# Altium project tracker-pro-airbnb-v1.0.PrjPcb (part 6 of 6)
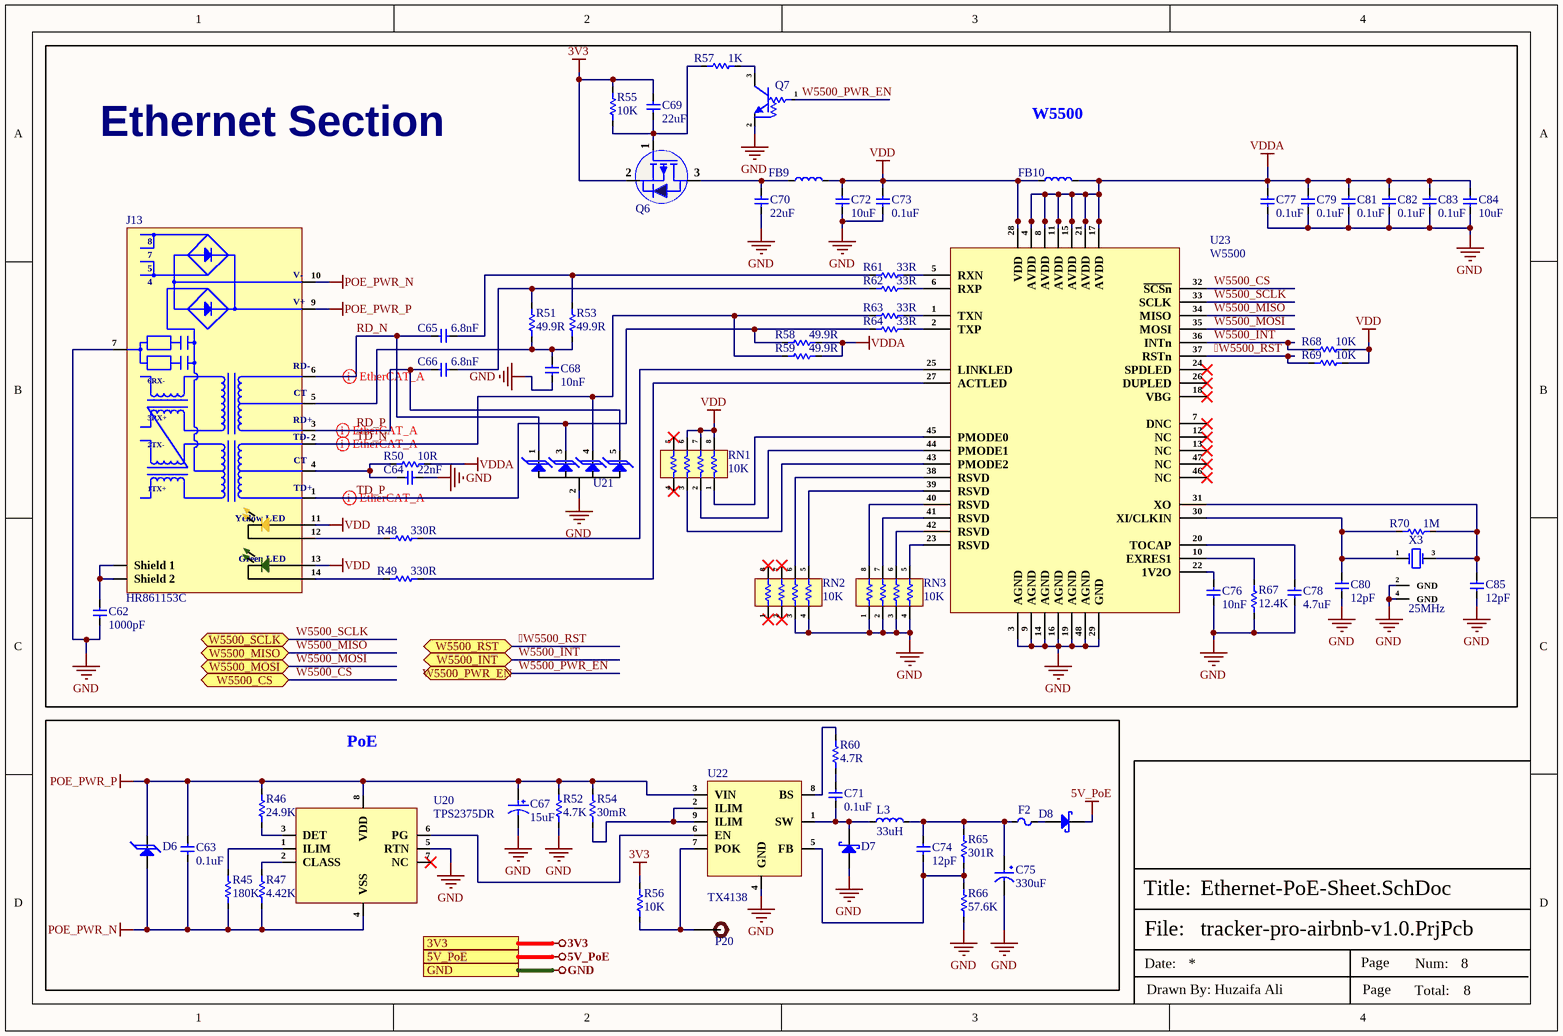
[diagram p9: Ethernet-PoE-Sheet.SchDoc]

## Sheet Ethernet-PoE-Sheet.SchDoc (continued)

### Library data of the parts (continued)
X3 = Q22FA12800090: CRYSTAL 25.0000MHZ 12PF SMD; Manufacturer: Seiko Epson; ComponentLink1Description: LCSC; ComponentLink1URL: https://www.lcsc.com/product-detail/Crystals_Seiko-Epson-Q22FA12800090_C255883.html; Manufacturer Part Number: Q22FA12800090; Package: SMD2016-4P; LCSC Part Number: C255883; Item Type: Crystal

## Sheet Sound-Detection-Sheet.SchDoc
size A4; SheetNumber: 6; SheetTotal: 8
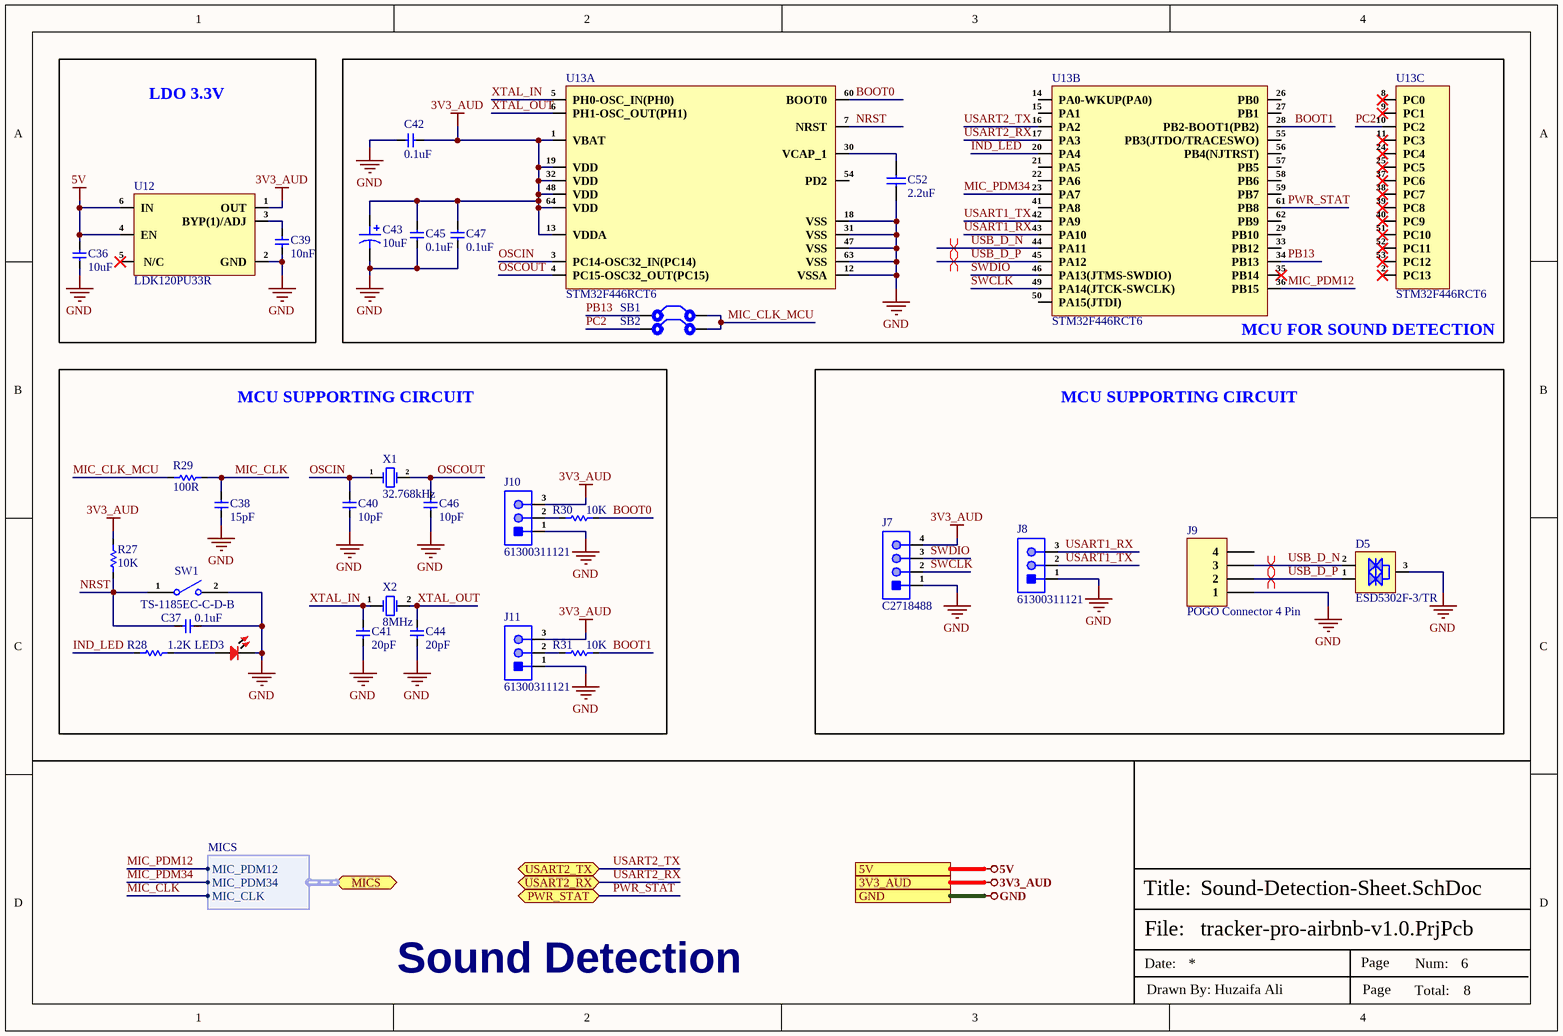
[diagram p7: Sound-Detection-Sheet.SchDoc]

### Parts
C36  10uF  [Cap-0402]
C37  0.1uF  [Cap-0402]
C38  15pF  [Cap-0603]
C39  10nF  [Cap-0603]
C40  10pF  [CAP-0201]
C41  20pF  [Cap-0603]
C42  0.1uF  [Cap-0402]
C43  10uF  [Case-A]
C44  20pF  [Cap-0603]
C45  0.1uF  [Cap-0402]
C46  10pF  [CAP-0201]
C47  0.1uF  [Cap-0402]
C52  2.2uF  [Cap-0805]
D5  ESD5302F-3/TR  [Sot-23]
J7  C2718488  [HDR1X4 Female]
J8  61300311121  [HDR1X3_]
J9  POGO Connector 4 Pin  [Pogo 4 Pin]
J10  61300311121  [HDR1X3_]
J11  61300311121  [HDR1X3_]
LED3  RED  [LED-0603]  (value not drawn)
R27  10K  [Res-0402]
R28  1.2K  [Res-0402]
R29  100R  [Res-0603]
R30  10K  [Res-0402]
R31  10K  [Res-0402]
SB1  Solder Bridge 0402  [Solder Bridge 0402]  (value not drawn)
SB2  Solder Bridge 0402  [Solder Bridge 0402]  (value not drawn)
SW1  TS-1185EC-C-D-B  [TS-1185EC-C-D-B_]
U12  LDK120PU33R  [6-DFN (1.2x1.3)]
U13  STM32F446RCT6  [64-LQFP (10x10)]  (parts A,B,C of 3)
X1  32.768kHz  [SMD3215-2P]
X2  8MHz  [SMD5032-2P]

### Blocks framed on the sheet
LDO 3.3V: C36 C39 U12
MCU FOR SOUND DETECTION: C42 C43 C45 C47 C52 SB1 SB2 U13
MCU SUPPORTING CIRCUIT: C37 C38 C40 C41 C44 C46 J10 J11 LED3 R27-R31 SW1 X1 X2
MCU SUPPORTING CIRCUIT: D5 J7-J9

### Ports
3V3_AUD, 5V, GND, MICS (bidir, harness MICS), PWR_STAT (bidir), USART2_RX (bidir), USART2_TX (bidir)

### Harnesses
MICS: MIC_PDM12, MIC_CLK, MIC_PDM34

### Nets
3V3_AUD: C42.1 C43.1 C45.2 C47.2 J7.4 J10.3 J11.3 R27.1 U12.1(OUT) U13.1(VBAT) U13.13(VDDA) U13.19(VDD) U13.32(VDD) U13.48(VDD) U13.64(VDD) ; port 3V3_AUD
5V: C36.2 U12.4(EN) U12.6(IN) ; port 5V
GND: C36.1 C37.1 C38.1 C39.1 C40.1 C41.1 C42.2 C43.2 C44.1 C45.1 C46.1 C47.1 C52.1 D5.3(GND) J7.1 J8.1 J9.1 J10.1 J11.1 LED3.2 SW1.2 U12.2(GND) U13.12(VSSA) U13.18(VSS) U13.31(VSS) U13.47(VSS) U13.63(VSS) ; port GND
BOOT0: R30.2 U13.60(BOOT0)
BOOT1: R31.2 U13.28(PB2-BOOT1(PB2))
IND_LED: R28.1 U13.20(PA4)
MIC_CLK: C38.2 R29.2 ; port MICS.MIC_CLK
MIC_CLK_MCU: R29.1 SB1.2 SB2.2
MIC_PDM12: U13.36(PB15) ; port MICS.MIC_PDM12
MIC_PDM34: U13.23(PA7) ; port MICS.MIC_PDM34
NRST: C37.2 R27.2 SW1.1 U13.7(NRST)
OSCIN: C40.2 U13.3(PC14-OSC32_IN(PC14)) X1.1(OSC1)
OSCOUT: C46.2 U13.4(PC15-OSC32_OUT(PC15)) X1.2(OSC2)
PB13: SB1.1 U13.34(PB13)
PC2: SB2.1 U13.10(PC2)
PWR_STAT: U13.61(PB8) ; port PWR_STAT
SWCLK: J7.2 U13.49(PA14(JTCK-SWCLK))
SWDIO: J7.3 U13.46(PA13(JTMS-SWDIO))
USART1_RX: J8.3 U13.43(PA10)
USART1_TX: J8.2 U13.42(PA9)
USART2_RX: U13.17(PA3) ; port USART2_RX  [project net GPIO38]
USART2_TX: U13.16(PA2) ; port USART2_TX  [project net GPIO9]
USB_D_N: D5.2(I/O2) J9.3 U13.44(PA11)
USB_D_P: D5.1(I/O1) J9.2 U13.45(PA12)
XTAL_IN: C41.2 U13.5(PH0-OSC_IN(PH0)) X2.1(OSC1)
XTAL_OUT: C44.2 U13.6(PH1-OSC_OUT(PH1)) X2.2(OSC2)
NetC39_2: C39.2 U12.3(BYP(1)/ADJ)
NetC52_2: C52.2 U13.30(VCAP_1)
NetJ10_2: J10.2 R30.1
NetJ11_2: J11.2 R31.1
NetLED3_1: LED3.1 R28.2

Not connected (* = marked no-connect by the designer): J9 4; U12 5(_N/C)*; U13 2(PC13)* 8(PC0)* 9(PC1)* 11(PC3)* 14(PA0-WKUP(PA0)) 15(PA1) 21(PA5) 22(PA6) 24(PC4)* 25(PC5)* 26(PB0) 27(PB1) 29(PB10) 33(PB12) 35(PB14)* 37(PC6)* 38(PC7)* 39(PC8)* 40(PC9)* 41(PA8) 50(PA15(JTDI)) 51(PC10)* 52(PC11)* 53(PC12)* 54(PD2) 55(PB3(JTDO/TRACESWO)) 56(PB4(NJTRST)) 57(PB5) 58(PB6) 59(PB7) 62(PB9)

### Layout directives
differential pair; net class STM_USB; differential pair class STM_USB_Lines; rule Impedance Constraint [Min = 87.00    Max = 92.00    ]; rule Matched Net Lengths [Tolerance = 0.508mm]: USB_D_N, USB_D_P

### Notes on the sheet
- Sound Detection
- File:
- Title:
- Date:
- Page
- Num:
- Total:
- Drawn By: Huzaifa Ali

### Library data of the parts
C36 = CC0402MRX5R6BB106: CAP CER 10UF 10V X5R 0402; Manufacturer: Yageo; Tolerance: 20%; Item Type: Capacitor; Supplier 1: Future Electronics; Manufacturer Part Number: CC0402MRX5R6BB106; RoHS: Yes; Category: Ceramic Capacitors; Stock 1: 80000; Pricing 1: 10000=0.02650, 20000=0.02590, 30000=0.02550, 40000=0.02530, 50000=0.02450 (USD); Mount: Surface Mount; Case/Package: 0402; Case Code (Imperial): 0402; Case Code (Metric): 1005; Min Operating Temperature: -55°C; Max Operating Temperature: 85°C; Packaging: Tape and Reel; Capacitance: 10uF; Voltage Rating: 10V; RoHS Compliant: Yes; ComponentLink1URL: http://www.yageo.com/documents/recent/UPY-GPHC_X5R_4V-to-50V_25.pdf?src-supplier=Digi-Key; ComponentLink1Description: http://www.yageo.com/documents/recent/UPY-GPHC_X5R_4V-to-50V_25.pdf?src-supplier=Digi-Key; Supplier Part Number 1: 6097631; LCSC Part Number: C962143
C37 C42 C45 C47 = C1005X5R1H104K050BB: CAP CER 0.1UF 50V X5R 0402; Manufacturer: TDK; Dielectric Material: Ceramic; Capacitance: 100nF; Tolerance: 10%; Supplier 1: Digi-Key; Manufacturer Part Number: C1005X5R1H104K050BB; Stock 1: 1455182; Pricing 1: 1=0.12, 10=0.09, 50=0.049, 100=0.04, 500=0.02858, 1000=0.02245, 2500=0.02041, 5000=0.01878 (USD); Mount: Surface Mount; Case/Package: 0402; Case Code (Metric): 1005; Case Code (Imperial): 0402; Weight: 2.3E-05oz; Min Operating Temperature: -55°C; Max Operating Temperature: 85°C; Dielectric: X5R; Voltage Rating: 50V; Packaging: Tape and Reel; Voltage Rating (DC): 50V; Termination: SMD/SMT; Construction: Flat; Package Quantity: 1; Resistor Type: Ceramic; Voltage: 50V; Series: C; Length: 1mm; Width: 0.02inch; Height: 0.5mm; Depth: 0.5mm; Thickness: 0.022inch; Radiation Hardening: No; Lead Free: Lead Free; REACH SVHC: No SVHC; RoHS Compliant: Yes; ComponentLink1URL: https://product.tdk.com/info/en/catalog/spec/mlccspec_commercial_general_midvoltage_en.pdf?src-supplier=Digi-Key; ComponentLink1Description: https://product.tdk.com/info/en/catalog/spec/mlccspec_commercial_general_midvoltage_en.pdf?src-supplier=Digi-Key; ComponentLink2URL: http://www.tdk.co.jp/tefe02/e413_c.pdf?src-supplier=Future+Electronics; ComponentLink2Description: http://www.tdk.co.jp/tefe02/e413_c.pdf?src-supplier=Future+Electronics; ComponentLink3URL: https://www.verical.com/server-webapp/html/getDatasheet?partID=743571&src-supplier=Verical; ComponentLink3Description: https://www.verical.com/server-webapp/html/getDatasheet?partID=743571&src-supplier=Verical; ComponentLink4URL: http://www.tdk.co.jp/tefe02/e412_c.pdf?src-supplier=Avnet+Europe; ComponentLink4Description: http://www.tdk.co.jp/tefe02/e412_c.pdf?src-supplier=Avnet+Europe; Supplier Part Number 1: 445-5942-1-ND; LCSC Part Number: C2181865
C38 = CC0603JRNPO9BN150: CAP CER 15PF 50V C0G/NPO 0603; Manufacturer: Yageo; Dielectric Material: Ceramic; Tolerance: 5%; Dielectric: C0G; Insulation Resistance: 100GR; Item Type: Capacitor; Supplier 1: Future Electronics; Manufacturer Part Number: CC0603JRNPO9BN150; RoHS: Yes; Category: Ceramic Capacitors; Stock 1: 832000; Pricing 1: 4000=0.0038, 16000=0.0036, 80000=0.0034, 160000=0.0033, 500000=0.0031 (USD); Mounting Technology: Surface Mount; Case/Package: 0603; Pins: 2; Case Code (Metric): 1608; Case Code (Imperial): 0603; Min Operating Temperature: -55°C; Max Operating Temperature: 125°C; Value: 15pF; Series: CC; Packaging: Tape and Reel; Package Quantity: 1; Termination: SMD/SMT; Voltage Rating: 50V; Length: 1.6mm; Width: 0.031inch; Height: 0.8mm; Depth: 0.8mm; Thickness: 0.035inch; Radiation Hardening: No; RoHS Compliant: Yes; Reach SVHC Compliant: No; Lead Free: Lead Free; ComponentLink1URL: https://datasheet.ciiva.com/144/mlccorderingcode-144635.pdf?src-supplier=Digi-Key; ComponentLink1Description: https://datasheet.ciiva.com/144/mlccorderingcode-144635.pdf?src-supplier=Digi-Key; ComponentLink2URL: https://datasheet.ciiva.com/144/mlccorderingcode-144636.pdf?src-supplier=Digi-Key; ComponentLink2Description: https://datasheet.ciiva.com/144/mlccorderingcode-144636.pdf?src-supplier=Digi-Key; ComponentLink3URL: https://datasheet.ciiva.com/8033/1443161-8033721.pdf?src-supplier=Element14; ComponentLink3Description: https://datasheet.ciiva.com/8033/1443161-8033721.pdf?src-supplier=Element14; ComponentLink4URL: https://datasheet.ciiva.com/28450/1443161-28450472.pdf?src-supplier=Element14; ComponentLink4Description: https://datasheet.ciiva.com/28450/1443161-28450472.pdf?src-supplier=Element14; ComponentLink5URL: https://datasheet.ciiva.com/144/mlccorderingcode-144634.pdf?src-supplier=Digi-Key; ComponentLink5Description: https://datasheet.ciiva.com/144/mlccorderingcode-144634.pdf?src-supplier=Digi-Key; ComponentLink6URL: https://datasheet.ciiva.com/8033/1734582-8033723.pdf?src-supplier=Element14; ComponentLink6Description: https://datasheet.ciiva.com/8033/1734582-8033723.pdf?src-supplier=Element14; ComponentLink7URL: https://datasheet.ciiva.com/8033/1734582-8033722.pdf?src-supplier=Element14; ComponentLink7Description: https://datasheet.ciiva.com/8033/1734582-8033722.pdf?src-supplier=Element14; ComponentLink8URL: https://datasheet.ciiva.com/11464/upy-gp-np0-16v-to-50v-8-11464727.pdf?src-supplier=Avnet; ComponentLink8Description: https://datasheet.ciiva.com/11464/upy-gp-np0-16v-to-50v-8-11464727.pdf?src-supplier=Avnet; Supplier Part Number 1: 4234670; LCSC Part Number: C107037
C39 = CC0603JRNPO9BN103: CAP CER 10000PF 50V C0G/NPO 0603; Manufacturer: Yageo; Tolerance: 5%; Item Type: Capacitor; Supplier 1: Arrow Electronics; Manufacturer Part Number: CC0603JRNPO9BN103; RoHS: Yes; Category: Ceramic Capacitors; Stock 1: 5425; Pricing 1: 1=0.42340, 10=0.29770, 25=0.25590, 100=0.19550, 250=0.19360, 500=0.14320, 1000=0.12060, 3000=0.11930 (USD); Mount: Surface Mount; Case/Package: 0603; Min Operating Temperature: -55°C; Max Operating Temperature: 125°C; Packaging: Tape and Reel; Capacitance: 10nF; Voltage Rating: 50V; Length: 0.063inch; Width: 0.031inch; Thickness: 0.035inch; RoHS Compliant: Yes; ComponentLink1URL: http://www.yageo.com/documents/recent/UPY-GP_NP0_16V-to-50V_16.pdf?src-supplier=Digi-Key; ComponentLink1Description: http://www.yageo.com/documents/recent/UPY-GP_NP0_16V-to-50V_16.pdf?src-supplier=Digi-Key; ComponentLink2URL: http://www.yageo.com/exep/pages/download/literatures/ProductSelectionGuide%202014_Final_2.pdf?src-supplier=Digi-Key; ComponentLink2Description: http://www.yageo.com/exep/pages/download/literatures/ProductSelectionGuide%202014_Final_2.pdf?src-supplier=Digi-Key; Supplier Part Number 1: CC0603JRNPO9BN103; LCSC Part Number: C389113
C40 C46 = CGA1A2C0G1E100D030BA: CAP CER 10PF 25V C0G 0201; Manufacturer: TDK; Item Type: Capacitor; Supplier 1: Digi-Key; Manufacturer Part Number: CGA1A2C0G1E100D030BA; RoHS: Yes; Category: Ceramic Capacitors; Stock 1: 28695; Pricing 1: 1=0.11000, 10=0.07900, 50=0.04340, 100=0.03540, 500=0.02530, 1000=0.01987, 2500=0.01807, 5000=0.01662 (USD); Mount: Surface Mount; Case/Package: 0201; Case Code (Imperial): 0201; Case Code (Metric): 0603; Weight: 6E-06oz; Min Operating Temperature: -55°C; Max Operating Temperature: 125°C; Packaging: Tape and Reel; Capacitance: 10pF; Voltage Rating: 25V; Termination: SMD/SMT; Voltage Rating (DC): 25V; Package Quantity: 1; Dielectric: C0G; Resistor Type: Ceramic; Series: CGA; Length: 0.6mm; Width: 0.3mm; Height: 0.3mm; Thickness: 0.013inch; Depth: 0.3mm; Ratings: AEC-Q200; RoHS Compliant: Yes; ComponentLink1URL: https://datasheet.ciiva.com/24220/cga1a2c0g1e100d030ba-271838-24220873.pdf?src-supplier=Mouser; ComponentLink1Description: https://datasheet.ciiva.com/24220/cga1a2c0g1e100d030ba-271838-24220873.pdf?src-supplier=Mouser; Supplier Part Number 1: 445-9023-1-ND; LCSC Part Number: C2168728
C41 C44 = CC0603JRNPO9BN200: CAP CER 20PF 50V C0G/NPO 0603; Manufacturer: Yageo; Tolerance: 5%; Dielectric: C0G; Supplier 1: Digi-Key; Manufacturer Part Number: CC0603JRNPO9BN200; Stock 1: 259568; Pricing 1: 1=0.1, 10=0.048, 100=0.0214, 500=0.01526, 1000=0.01198 (USD); Mount: Surface Mount; Case/Package: 0603; Number of Pins: 2; Weight: 7.1E-05oz; Case Code (Imperial): 0603; Case Code (Metric): 1608; Min Operating Temperature: -55°C; Max Operating Temperature: 125°C; Capacitance: 20pF; Package Quantity: 4000; Voltage Rating (DC): 50V; Packaging: Tape and Reel; Voltage Rating: 50V; Termination: SMD/SMT; Composition: Ceramic; Length: 1.6mm; Width: 0.8mm; Thickness: 0.035inch; Depth: 0.8mm; REACH SVHC: Unknown; Lead Free: Lead Free; ComponentLink1URL: http://www.farnell.com/datasheets/1132289.pdf?src-supplier=Element14; ComponentLink1Description: http://www.farnell.com/datasheets/1132289.pdf?src-supplier=Element14; ComponentLink2URL: http://www.yageo.com/documents/recent/UPY-GP_NP0_16V-to-50V_16.pdf?src-supplier=Digi-Key; ComponentLink2Description: http://www.yageo.com/documents/recent/UPY-GP_NP0_16V-to-50V_16.pdf?src-supplier=Digi-Key; Supplier Part Number 1: 311-1424-6-ND; LCSC Part Number: C105621
C43 = CA45-A-10V-10uF-K: 10uF 10V 8Ω@100kHz ±10% CASE-A-3216 Tantalum Capacitors ROHS; Manufacturer: CEC(Shenzhen Zhenhua XinYun Elec); Manufacturer Part Number: CA45-A-10V-10uF-K; Package: CASE-A-3216; LCSC Part Number: C128253; Item Type: Capacitor; ComponentLink1Description: LCSC; ComponentLink1URL: https://www.lcsc.com/product-detail/Tantalum-Capacitors_CEC-Shenzhen-Zhenhua-XinYun-Elec-CA45-A-10V-10uF-K_C128253.html
C52 = CC0805KKX5R9BB225: CAP CER 2.2UF 50V X5R 0805; Manufacturer: Yageo; Tolerance: 10%; Item Type: Capacitor; Supplier 1: Mouser; Manufacturer Part Number: CC0805KKX5R9BB225; RoHS: Yes; Category: Ceramic Capacitors; Stock 1: 3880; Pricing 1: 1=0.26000, 10=0.12100, 50=0.12100, 100=0.08700, 1000=0.06700, 10000=0.05000 (USD); Mounting Technology: Surface Mount; Case/Package: 0805; Case Code (Metric): 2012; Case Code (Imperial): 0805; Weight: 0.000194oz; Min Operating Temperature: -55°C; Max Operating Temperature: 85°C; Packaging: Tape and Reel; Value: 2.2uF; Voltage Rating: 50V; Dielectric: X5R; Termination: SMD/SMT; Resistor Type: Ceramic; Voltage Rating (DC): 50V; Package Quantity: 3000; Length: 0.079inch; Width: 1.25mm; Thickness: 0.057inch; Lead Free: Lead Free; Halogen Free: Halogen Free; RoHS Compliant: Yes; ComponentLink1URL: http://www.mouser.com/ds/2/447/Yageo_UPY-GP_NP0_16V-to-50V_9-358835.pdf?src-supplier=Mouser; ComponentLink1Description: http://www.mouser.com/ds/2/447/Yageo_UPY-GP_NP0_16V-to-50V_9-358835.pdf?src-supplier=Mouser; ComponentLink2URL: http://www.yageo.com/documents/recent/UPY-GPHC_X5R_4V-to-50V_25.pdf?src-supplier=Digi-Key; ComponentLink2Description: http://www.yageo.com/documents/recent/UPY-GPHC_X5R_4V-to-50V_25.pdf?src-supplier=Digi-Key; Supplier Part Number 1: 603-CC805KKX5R9BB225; LCSC Part Number: C326581
D5 = ESD5302F-3/TR: 16A 20V 7V 5V@Max Unidirectional SOT-23 TVS ROHS; Manufacturer: WILLSEMI; Item Type: Diode; Manufacturer Part Number: ESD5302F-3/TR; Package: SOT-23; LCSC Part Number: C239643; ComponentLink1Description: LCSC; ComponentLink1URL: https://www.lcsc.com/product-detail/TVS_WILLSEMI-Will-Semicon-ESD5302F-3-TR_C239643.html
J7 = C2718488: 2.54mm Plugin 3A bronze -40℃~+105℃ Straight 1x4P Top 4 Square Holes Plugin,P=2.54mm Female Headers ROHS; Manufacturer: BOOMELE; Item Type: Header; Manufacturer Part Number: C2718488; Package: Plugin,P=2.54mm; LCSC Part Number: C2718488; ComponentLink1Description: LCSC; ComponentLink1URL: https://www.lcsc.com/product-detail/Female-Headers_BOOMELE-Boom-Precision-Elec-C2718488_C2718488.html
J8 J10 J11 = 61300311121: CONN HEADER VERT 3POS 2.54MM; Manufacturer: Wurth Electronics; Number of Positions: 3; Gender: Male; Connector Type: Male Pin; Pitch: 0.1inch; Item Type: Male Header; Supplier 1: Digi-Key; Manufacturer Part Number: 61300311121; Stock 1: 81286; Pricing 1: 1=0.13, 10=0.106, 25=0.088, 50=0.074, 100=0.067, 1000=0.061 (USD); Mount: Through Hole; Contact Plating: Gold; Contact Material: Copper; Color: Black; Number of Rows: 1; Packaging: Bulk; Termination: Solder; Number of Contacts: 3; Contact Mating Length: 0.236inch; REACH SVHC: Unknown; Lead Free: Lead Free; ComponentLink1URL: http://www.farnell.com/cad/1737268.pdf?src-supplier=Element14; ComponentLink1Description: http://www.farnell.com/cad/1737268.pdf?src-supplier=Element14; ComponentLink2URL: https://katalog.we-online.de/em/datasheet/6130xx11121.pdf?src-supplier=Digi-Key; ComponentLink2Description: https://katalog.we-online.de/em/datasheet/6130xx11121.pdf?src-supplier=Digi-Key; Supplier Part Number 1: 732-5316-ND
J9 = POGO Connector 4 Pin: Pogo Pad 2.5mm 4 Pin; Item Type: Pogo Connector; Manufacturer Part Number: POGO Connector 4 Pin
LED3 = NCD0603R3: RED LED 0603 Light Emitting Diodes; Manufacturer: Foshan NationStar Optoelectronics; Manufacturer Part Number: NCD0603R3; Package: 0603; Item Type: LED; LCSC Part Number: C3151730; ComponentLink1Description: LCSC; ComponentLink1URL: https://www.lcsc.com/product-detail/Light-Emitting-Diodes-LED_Foshan-NationStar-Optoelectronics-NCD0603R3_C3151730.html
R27 R30 R31 = RC0402FR-0710KL: RES 10K OHM 1% 1/16W 0402; Manufacturer: Yageo; Resistance: 10kR; Voltage Rating (DC): 50V; Temperature Coefficient: 100ppm/°C; Power Rating: 62.5mW; Max Power Dissipation: 63mW; Item Type: Resistor; Supplier 1: Mouser; Manufacturer Part Number: RC0402FR-0710KL; RoHS: Yes; Category: Chip SMD Resistors; Stock 1: 18648329; Pricing 1: 1=0.10000, 10=0.01400, 50=0.01400, 100=0.00500, 1000=0.00300, 10000=0.00200 (USD); Case/Package: 0402; Number of Pins: 2; Case Code (Imperial): 0402; Case Code (Metric): 1005; Min Operating Temperature: -55°C; Max Operating Temperature: 155°C; Resistor Type: Thick Film; Tolerance: 1%; Packaging: Tape and Reel; Voltage Rating: 50V; Termination: SMD/SMT; Working Voltage: 50V; Number of Terminations: 2; Features: Moisture Resistant; Series: RC; Resistance Tolerance: 1%; Construction: Rectangular; Length: 1mm; Width: 0.5mm; Height: 0.32mm; Depth: 0.5mm; Lead Pitch: 0.2mm; REACH SVHC: No SVHC; Lead Free: Lead Free; RoHS Compliant: Yes; Military Standard: Not; ComponentLink1URL: https://datasheet.ciiva.com/7660/38568-7660787.pdf?src-supplier=Element14; ComponentLink1Description: https://datasheet.ciiva.com/7660/38568-7660787.pdf?src-supplier=Element14; ComponentLink2URL: https://datasheet.ciiva.com/7849/1686128-7849814.pdf?src-supplier=Element14; ComponentLink2Description: https://datasheet.ciiva.com/7849/1686128-7849814.pdf?src-supplier=Element14; ComponentLink3URL: https://datasheet.ciiva.com/7983/1018594-7983486.pdf?src-supplier=Element14; ComponentLink3Description: https://datasheet.ciiva.com/7983/1018594-7983486.pdf?src-supplier=Element14; ComponentLink4URL: https://datasheet.ciiva.com/22747/1018594-22747512.pdf?src-supplier=Element14; ComponentLink4Description: https://datasheet.ciiva.com/22747/1018594-22747512.pdf?src-supplier=Element14; ComponentLink5URL: https://datasheet.ciiva.com/12667/pyu-rc0402-51-rohs-l-6-r-12667067.pdf?src-supplier=Mouser; ComponentLink5Description: https://datasheet.ciiva.com/12667/pyu-rc0402-51-rohs-l-6-r-12667067.pdf?src-supplier=Mouser; ComponentLink6URL: https://datasheet.ciiva.com/7849/1784430-7849813.pdf?src-supplier=Element14; ComponentLink6Description: https://datasheet.ciiva.com/7849/1784430-7849813.pdf?src-supplier=Element14; ComponentLink7URL: https://datasheet.ciiva.com/7849/1784430-7849815.pdf?src-supplier=Element14; ComponentLink7Description: https://datasheet.ciiva.com/7849/1784430-7849815.pdf?src-supplier=Element14; Supplier Part Number 1: 603-RC0402FR-0710KL; LCSC Part Number: C60490
R28 = RC0402FR-071K2L: RES 1.2K OHM 1% 1/16W 0402; Manufacturer: Yageo; Resistance: 1.2kR; Power Rating: 63mW; Voltage Rating: 50V; Temperature Coefficient: 100ppm/°C; Item Type: Resistor; Supplier 1: Avnet; Manufacturer Part Number: RC0402FR-071K2L; RoHS: Yes; Category: Chip SMD Resistors; Stock 1: 170000; Pricing 1: 10000=0.00085 (USD); Case/Package: 0402; Case Code (Imperial): 0402; Case Code (Metric): 1005; Size Code: 0402; Min Operating Temperature: -55°C; Max Operating Temperature: 155°C; Tolerance: 1%; Packaging: Tape and Reel; Package Quantity: 1; Termination: SMD/SMT; Resistor Type: Thick Film; Number of Terminations: 2; Max Power Dissipation: 63mW; Features: Moisture Resistant; Series: RC; Construction: Rectangular; Resistance Tolerance: 1%; Technology: THICK FILM; Length: 0.039inch; Width: 0.02inch; Height: 0.016inch; Depth: 0.5mm; Military Standard: Not; Lead Free: Lead Free; RoHS Compliant: Yes; ComponentLink1URL: https://datasheet.ciiva.com/11808/0900766b80c66297-11808455.pdf?src-supplier=RSComponents; ComponentLink1Description: https://datasheet.ciiva.com/11808/0900766b80c66297-11808455.pdf?src-supplier=RSComponents; ComponentLink2URL: https://datasheet.ciiva.com/2453/pyu-r-int-thick-7-2453467.pdf?src-supplier=Digi-Key; ComponentLink2Description: https://datasheet.ciiva.com/2453/pyu-r-int-thick-7-2453467.pdf?src-supplier=Digi-Key; ComponentLink3URL: https://datasheet.ciiva.com/2453/pyu-r-int-thick-7-2453468.pdf?src-supplier=Digi-Key; ComponentLink3Description: https://datasheet.ciiva.com/2453/pyu-r-int-thick-7-2453468.pdf?src-supplier=Digi-Key; ComponentLink4URL: https://datasheet.ciiva.com/2453/pyu-r-int-thick-7-2453466.pdf?src-supplier=Digi-Key; ComponentLink4Description: https://datasheet.ciiva.com/2453/pyu-r-int-thick-7-2453466.pdf?src-supplier=Digi-Key; ComponentLink5URL: https://datasheet.ciiva.com/7849/1018594-7849861.pdf?src-supplier=Element14; ComponentLink5Description: https://datasheet.ciiva.com/7849/1018594-7849861.pdf?src-supplier=Element14; ComponentLink6URL: https://datasheet.ciiva.com/7849/1018594-7849862.pdf?src-supplier=Element14; ComponentLink6Description: https://datasheet.ciiva.com/7849/1018594-7849862.pdf?src-supplier=Element14; ComponentLink7URL: https://datasheet.ciiva.com/15189/getdatasheetpartid-323716-15189366.pdf?src-supplier=Verical; ComponentLink7Description: https://datasheet.ciiva.com/15189/getdatasheetpartid-323716-15189366.pdf?src-supplier=Verical; ComponentLink8URL: https://datasheet.ciiva.com/16745/pyu-rc0402-51-rohs-l-6-r-16745005.pdf?src-supplier=Future+Electronics; ComponentLink8Description: https://datasheet.ciiva.com/16745/pyu-rc0402-51-rohs-l-6-r-16745005.pdf?src-supplier=Future+Electronics; Supplier Part Number 1: RC0402FR-071K2L; LCSC Part Number: C138040
R29 = RC0603FR-07100RL: RES SMD 100 OHM 1% 1/10W 0603; Manufacturer: Yageo; Temperature Coefficient: 100ppm/°C; Voltage Rating (DC): 50V; Power Rating: 100mW; Supplier 1: Arrow Electronics; Manufacturer Part Number: RC0603FR-07100RL; RoHS: Yes; Category: Chip SMD Resistors; Stock 1: 3800000; Pricing 1: 5000=0.00300, 5000=0.00200, 5000=0.00450, 50000=0.00410, 500000=0.00230, 2500000=0.00140 (USD); Case/Package: 0603; Number of Pins: 2; Case Code (Imperial): 0603; Case Code (Metric): 1608; Size Code: 0603; Min Operating Temperature: -55°C; Max Operating Temperature: 155°C; Resistance: 100R; Tolerance: 1%; Resistor Type: Thick Film; Packaging: Tape and Reel; Voltage Rating: 50V; Termination: SMD/SMT; Features: Moisture Resistant; Series: RC; Max Power Dissipation: 100mW; Number of Terminations: 2; Construction: Rectangular; Resistance Tolerance: 1%; Technology: THICK FILM; Length: 1.6mm; Width: 0.8mm; Height: 0.45mm; Depth: 0.8mm; REACH SVHC: Unknown; Lead Free: Lead Free; RoHS Compliant: Yes; Military Standard: Not; Supplier Part Number 1: RC0603FR-07100RL; LCSC Part Number: C105588
SB1 SB2 = Solder Bridge 0402: Solder Bridge ON; Manufacturer Part Number: Solder Bridge 0402; Item Type: Solder Bridge
SW1 = TS-1185EC-C-D-B: 3mm 2mm Round Button 50mA Top3.65mm SPST 12V SMD Tactile Switches; Manufacturer: XKB; Manufacturer Part Number: TS-1185EC-C-D-B; Footprint: Custom; ComponentLink1Description: LCSC; ComponentLink1URL: https://lcsc.com/product-detail/Tactile-Switches_XKB-Connectivity-TS-1185EC-C-D-B_C318893.html; LCSC Part Number: C318893
U12 = LDK120PU33R: IC REG LINEAR 3.3V 200MA 6DFN; Manufacturer: STMicroelectronics; Number of Outputs: 1; Min Input Voltage: 1.9V; Max Supply Voltage: 5.5V; Dropout Voltage: 150mV; Polarity: Positive; Quiescent Current: 60uA; Accuracy: 2%; Operating Supply Current: 50uA; Power Supply Rejection Ratio (PSRR): 55dB; Output Type: Fixed; Supplier 1: Mouser; Manufacturer Part Number: LDK120PU33R; RoHS: Yes; Category: Voltage Regulators - Linear; Stock 1: 1169; Pricing 1: 1=0.91, 10=0.752, 50=0.752, 100=0.614, 1000=0.388, 10000=0.343 (USD); Mounting Technology: Surface Mount; Case/Package: DFN; Pins: 6; Min Operating Temperature: -40°C; Max Operating Temperature: 125°C; Packaging: Tape and Reel; Max Output current: 200mA; Output Voltage: 3.3V; Output Current: 200mA; Number of Regulators: 1; Nominal Output Voltage: 3.3V; Package Quantity: 6000; Series: -; Length: 1.3mm; Width: 1.2mm; Height: 0.45mm; Radiation Hardening: No; Reach SVHC Compliant: No; Lead Free: Lead Free; RoHS Compliant: Yes; ComponentLink1URL: https://datasheet.ciiva.com/48475/dm00070790-48475005.pdf?src-supplier=Avnet; ComponentLink1Description: https://datasheet.ciiva.com/48475/dm00070790-48475005.pdf?src-supplier=Avnet; Supplier Part Number 1: 511-LDK120PU33R; LCSC Part Number: C2971162; Item Type: IC
U13 = STM32F446RCT6: IC MCU 32BIT 256KB FLASH 64LQFP; Manufacturer: STMicroelectronics; Number of I/Os: 50; Frequency: 180MHz; RAM Size: 128KB; Min Supply Voltage: 1.7V; Max Supply Voltage: 3.6V; Supplier 1: Mouser; Manufacturer Part Number: STM32F446RCT6; RoHS: Yes; Category: Microcontrollers; Stock 1: 998; Pricing 1: 1=10.62, 10=9.6, 50=8.98, 100=7.95, 1000=6.28, 10000=6.28 (USD); Case/Package: LQFP; Pins: 64; Memory Size: 256KB; RoHS Compliant: Yes; Reach SVHC Compliant: No; Lead Free: Lead Free; ComponentLink1URL: http://www.farnell.com/datasheets/2309063.pdf?src-supplier=Farnell; ComponentLink1Description: http://www.farnell.com/datasheets/2309063.pdf?src-supplier=Farnell; ComponentLink2URL: http://www.mouser.com/ds/2/389/stm32f446mc-956216.pdf?src-supplier=Mouser; ComponentLink2Description: http://www.mouser.com/ds/2/389/stm32f446mc-956216.pdf?src-supplier=Mouser; ComponentLink3URL: http://www.farnell.com/datasheets/2309063.pdf?src-supplier=Element14; ComponentLink3Description: http://www.farnell.com/datasheets/2309063.pdf?src-supplier=Element14; ComponentLink4URL: http://www.st.com/content/ccc/resource/technical/document/errata_sheet/c3/6b/f8/32/fc/01/48/6e/DM00155929.pdf/files/DM00155929.pdf/jcr:content/translations/en.DM00155929.pdf?src-supplier=Digi-Key; ComponentLink4Description: http://www.st.com/content/ccc/resource/technical/document/errata_sheet/c3/6b/f8/32/fc/01/48/6e/DM00155929.pdf/files/DM00155929.pdf/jcr:content/translations/en.DM00155929.pdf?src-supplier=Digi-Key; ComponentLink5URL: http://www.farnell.com/datasheets/2309063.pdf?src-supplier=Newark; ComponentLink5Description: http://www.farnell.com/datasheets/2309063.pdf?src-supplier=Newark; ComponentLink6URL: http://www.st.com/st-web-ui/static/active/en/resource/technical/document/datasheet/DM00141306.pdf?src-supplier=Avnet; ComponentLink6Description: http://www.st.com/st-web-ui/static/active/en/resource/technical/document/datasheet/DM00141306.pdf?src-supplier=Avnet; Supplier Part Number 1: 511-STM32F446RCT6; LCSC Part Number: C915971; Item Type: IC
X1 = DXTF321532768C10F: 32.768kHz 7pF ±10ppm SMD3215-2P Crystals ROHS; Manufacturer: Shenzhen; Manufacturer Part Number: DXTF321532768C10F; Package: SMD3215-2P; LCSC Part Number: C5830643; Item Type: Crystal; ComponentLink1Description: LCSC; ComponentLink1URL: https://www.lcsc.com/product-detail/Crystals_Shenzhen-SCTF-Elec-DXTF321532768C10F_C5830643.html
X2 = X50328MSB2GI: 8MHz 20pF ±10ppm ±50ppm SMD5032-2P Crystals ROHS; Manufacturer: Yangxing Tech; Manufacturer Part Number: X50328MSB2GI; Package: SMD5032-2P; LCSC Part Number: C115962; Item Type: Crystal; ComponentLink1Description: LCSC; ComponentLink1URL: https://www.lcsc.com/product-detail/Crystals_Yangxing-Tech-X50328MSB2GI_C115962.html

## Nets that join several sheets
1V8: Power-Sheet (C12.2 C14.2 FB4.1 U2.5), Sensor-Sheet (C27.1 U7.4)
1V8_SENSOR: Power-Sheet (C16.2 FB4.2 P2.1), Sensor-Sheet (J4.17), Level_Shifter_Sheet (FB7.1)
3V3: Power-Sheet (C19.1 P7.1 U3.2), Charging-Boost-Sheet (R13.2), Sensor-Sheet (16 pins), Level_Shifter_Sheet (FB8.1), ESP32-Sheet (13 pins), Ethernet-PoE-Sheet (C69.2 Q6.2 R55.1 R56.2)
3V3_AUD: Sensor-Sheet (J4.7), Sound-Detection-Sheet (15 pins)
3V3_SENSOR: Power-Sheet (C15.2 FB3.2 P3.1), Sensor-Sheet (J4.18)
5V: Power-Sheet (8 pins), Charging-Boost-Sheet (U5.2 U5.7), Sensor-Sheet (7 pins), ESP32-Sheet (R42.1), Sound-Detection-Sheet (C36.2 U12.4 U12.6)
5V_PoE: Power-Sheet (Q1.3), Charging-Boost-Sheet (Q2.3), Ethernet-PoE-Sheet (D8.1)
GND: Power-Sheet (30 pins), Charging-Boost-Sheet (15 pins), Sensor-Sheet (22 pins), Level_Shifter_Sheet (C34.1 C35.1 U11.11), ESP32-Sheet (11 pins), Ethernet-PoE-Sheet (42 pins), Sound-Detection-Sheet (27 pins)
VBUS: Power-Sheet (6 pins), Charging-Boost-Sheet (5 pins)
W5500_RST: ESP32-Sheet (U18.19), Ethernet-PoE-Sheet (R69.2 U23.37)
A1: Sensor-Sheet (J4.11), Level_Shifter_Sheet (U11.1)
A2: Sensor-Sheet (J4.12), Level_Shifter_Sheet (U11.3)
A3: Sensor-Sheet (J4.13), Level_Shifter_Sheet (U11.4)
A4: Sensor-Sheet (J4.14), Level_Shifter_Sheet (U11.5)
A5: Sensor-Sheet (J4.15), Level_Shifter_Sheet (U11.6)
A6: Sensor-Sheet (J4.16), Level_Shifter_Sheet (U11.7)
B1: Level_Shifter_Sheet (U11.20), ESP32-Sheet (P18.1 U18.18)
B2: Level_Shifter_Sheet (U11.18), ESP32-Sheet (P17.1 U18.12)
B3: Level_Shifter_Sheet (U11.17), ESP32-Sheet (P16.1 U18.7)
B4: Level_Shifter_Sheet (U11.16), ESP32-Sheet (P15.1 U18.6)
B5: Level_Shifter_Sheet (U11.15), ESP32-Sheet (U18.22)
B6: Level_Shifter_Sheet (U11.14), ESP32-Sheet (U18.8)
CH2O_RX: Sensor-Sheet (SB6.1), ESP32-Sheet (U18.25)
CH2O_TX: Sensor-Sheet (SB5.1), ESP32-Sheet (U18.26)
CO: Sensor-Sheet (R22.2 U8.H), ESP32-Sheet (U19.6)
GPIO9: ESP32-Sheet (U18.17), Sound-Detection-Sheet (U13.16)
GPIO12: ESP32-Sheet (U18.20), Ethernet-PoE-Sheet (R68.2 U23.36)
GPIO13: ESP32-Sheet (U18.21), Ethernet-PoE-Sheet (Q7.1)
GPIO16: Sensor-Sheet (J4.4 R25.1), ESP32-Sheet (U18.9)
GPIO38: ESP32-Sheet (U18.31), Sound-Detection-Sheet (U13.17)
GPIO39: Sensor-Sheet (J5.3 Q4.1 R24.1), ESP32-Sheet (U18.32)
GPIO40: Sensor-Sheet (J5.4 J6.2 P11.1), ESP32-Sheet (U18.33)
GPIO41: Sensor-Sheet (J5.5 J6.3 P12.1), ESP32-Sheet (U18.34)
GPIO42: Sensor-Sheet (J5.6 R23.1), ESP32-Sheet (U18.35)
LED_DIN: Sensor-Sheet (J4.3), ESP32-Sheet (R43.2)
MIC_CLK: Sensor-Sheet (J4.8), Sound-Detection-Sheet (C38.2 R29.2)
MIC_PDM12: Sensor-Sheet (J4.9), Sound-Detection-Sheet (U13.36)
MIC_PDM34: Sensor-Sheet (J4.10), Sound-Detection-Sheet (U13.23)
NH3: Sensor-Sheet (R21.2 U8.D), ESP32-Sheet (U19.5)
NO2: Sensor-Sheet (R20.2 U8.A), ESP32-Sheet (U19.4)
PWR_STAT: Charging-Boost-Sheet (P9.1 R13.1 U5.8), Sound-Detection-Sheet (U13.61)
SCL: Sensor-Sheet (J4.6 U7.2 U9.4), ESP32-Sheet (P13.1 R37.1 U18.10 U19.10)
SDA: Sensor-Sheet (J4.5 U7.1 U9.3), ESP32-Sheet (P14.1 R38.1 U18.11 U19.9)
SPI2_CS_IO5: ESP32-Sheet (U18.5), Ethernet-PoE-Sheet (U23.32)
SPI2_MISO_IO1: ESP32-Sheet (U18.39), Ethernet-PoE-Sheet (U23.34)
SPI2_MOSI_IO2: ESP32-Sheet (U18.38), Ethernet-PoE-Sheet (U23.35)
SPI2_SCK_IO4: ESP32-Sheet (U18.4), Ethernet-PoE-Sheet (U23.33)
USB_N: Power-Sheet (D1.4 J1.A7 J1.B7), ESP32-Sheet (U18.13)
USB_P: Power-Sheet (D1.3 J1.A6 J1.B6), ESP32-Sheet (U18.14)